# Altium schematic sheet Connector_Sheet.SchDoc
size A4; SheetNumber: 5; SheetTotal: 5
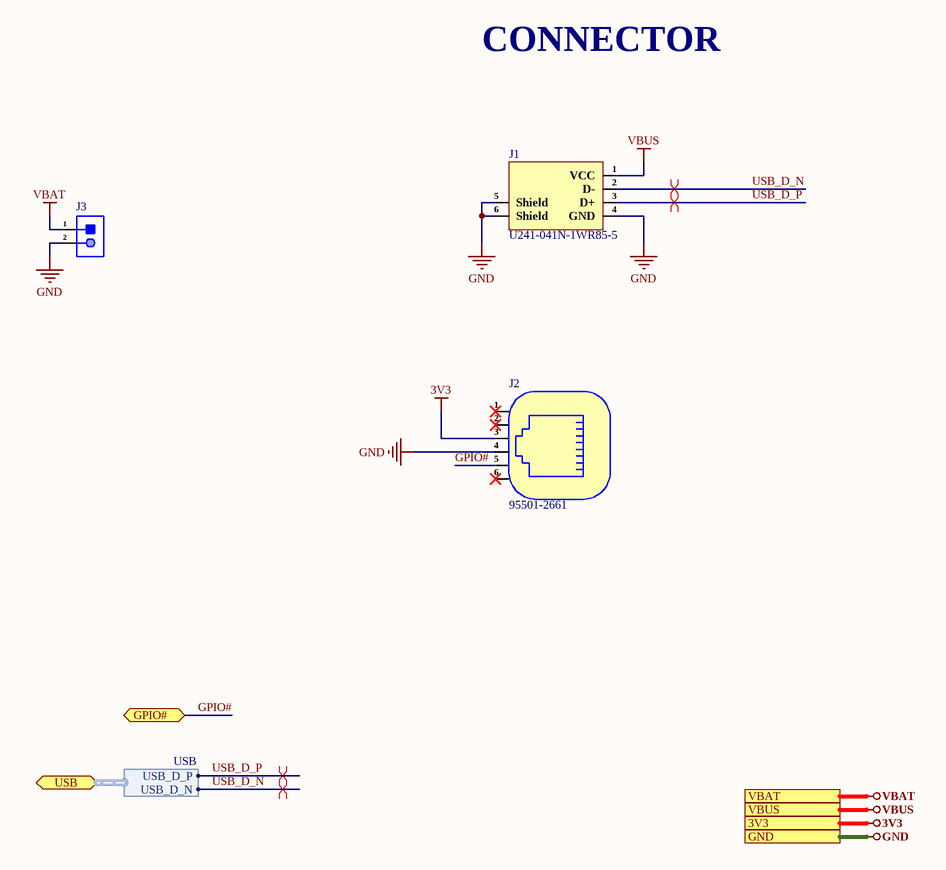
[diagram p0: Connector_Sheet.SchDoc]

## Parts
J1  U241-041N-1WR85-5  [U241-041N-1WR85-5]
J2  95501-2661  [955012661]
J3  Battery Pads  [Battery Pads]  (value not drawn)  (no BOM)

## Ports
3V3 (see Top_Sheet[3C], Controller_Sheet[3D], OLED & Buzzer_Sheet[3D], Power_Sheet[3D], USB-to-UART-Sheet[3D]), GND (see Top_Sheet[3C], Controller_Sheet[3D], OLED & Buzzer_Sheet[3D], Power_Sheet[3D], USB-to-UART-Sheet[3D]), GPIO# (bidir, see Top_Sheet[2C], Controller_Sheet[1D]), USB (bidir, harness USB, see Top_Sheet[2C], USB-to-UART-Sheet[2D]), VBAT (see Top_Sheet[3C], Power_Sheet[3D]), VBUS (see Top_Sheet[3C], Power_Sheet[3D], USB-to-UART-Sheet[3D])

## Harnesses
USB: USB_D_P, USB_D_N

## Nets
3V3: J2.3 ; port 3V3
GND: J1.4(GND) J1.5(Shield) J1.6(Shield) J2.4 J3.2 ; port GND
VBAT: J3.1 ; port VBAT
VBUS: J1.1(VCC) ; port VBUS
GPIO#: J2.5 ; port GPIO#
USB_D_N: J1.2(D-) ; port USB.USB_D_N
USB_D_P: J1.3(D+) ; port USB.USB_D_P

Not connected (* = marked no-connect by the designer): J2 1* 2* 6*

## Layout directives
differential pair; net class USB; differential pair class USB_Lines; rule Impedance Constraint [Min = 85.00    Max = 90.00    ]; rule Matched Net Lengths [Tolerance = 50mil]: USB_D_N, USB_D_P

## Notes on the sheet
- CONNECTOR
- File:
- Title:
- Date:
- Page
- Num:
- Total:
- Drawn By: Huzaifa Ali

## Library data of the parts
J1 = U241-041N-1WR85-5: 1.5A USB 2.0 1 235℃ Bend insert 4P Female -40℃~+85℃ Gold Brass Type-B Plugin USB Connectors ROHS; Manufacturer: XKB Connection; Item Type: USB B Connector; Manufacturer Part Number: U241-041N-1WR85-5; Package: Plugin; LCSC Part Number: C388656; ComponentLink1Description: LCSC; ComponentLink1URL: https://www.lcsc.com/product-detail/span-style-background-color-ff0-USB-span-Connectors_XKB-Connection-U241-041N-1WR85-5_C388656.html
J2 = 95501-2661: CONN MOD JACK 6P6C R/A UNSHLD; Manufacturer: Molex; Item Type: RJ12 Connector; Plating: 154ConductorMaterial; Voltage Rating: 125V; Supplier: Mouser; LCSC Part Number: C240856; Manufacturer Part Number: 95501-2661; RoHS: Yes; Stock: 3340; Pricing: 1=0.9, 10=0.656, 50=0.656, 100=0.577, 1000=0.577, 10000=0.576 (USD); ComponentLink1URL: https://datasheet.ciiva.com/11726/0900766b801680eb-11726054.pdf?src-supplier=Rs; ComponentLink1Description: https://datasheet.ciiva.com/11726/0900766b801680eb-11726054.pdf?src-supplier=Rs; ComponentLink2URL: https://datasheet.ciiva.com/23653/10889-23653499.pdf?src-supplier=Newark; ComponentLink2Description: https://datasheet.ciiva.com/23653/10889-23653499.pdf?src-supplier=Newark; ComponentLink3URL: https://datasheet.ciiva.com/4562/0955012661-modular-jacks-plug-177638-4562407.pdf?src-supplier=Mouser; ComponentLink3Description: https://datasheet.ciiva.com/4562/0955012661-modular-jacks-plug-177638-4562407.pdf?src-supplier=Mouser; ComponentLink4URL: https://datasheet.ciiva.com/30251/65060955012661-modular-jacks-plug-30251660.pdf?src-supplier=Onlinecomponents.com; ComponentLink4Description: https://datasheet.ciiva.com/30251/65060955012661-modular-jacks-plug-30251660.pdf?src-supplier=Onlinecomponents.com; ComponentLink5URL: https://datasheet.ciiva.com/16075/360890955012661-modular-jacks-plug-16075547.pdf?src-supplier=Onlinecomponents.com; ComponentLink5Description: https://datasheet.ciiva.com/16075/360890955012661-modular-jacks-plug-16075547.pdf?src-supplier=Onlinecomponents.com; ComponentLink6URL: https://datasheet.ciiva.com/1108/1597654-1108695.pdf?src-supplier=Element14; ComponentLink6Description: https://datasheet.ciiva.com/1108/1597654-1108695.pdf?src-supplier=Element14
J3 = Battery Pads: Wire Connecting Pads